# Altium schematic sheet Top_Sheet.SchDoc
size A4; SheetNumber: 1; SheetTotal: 6
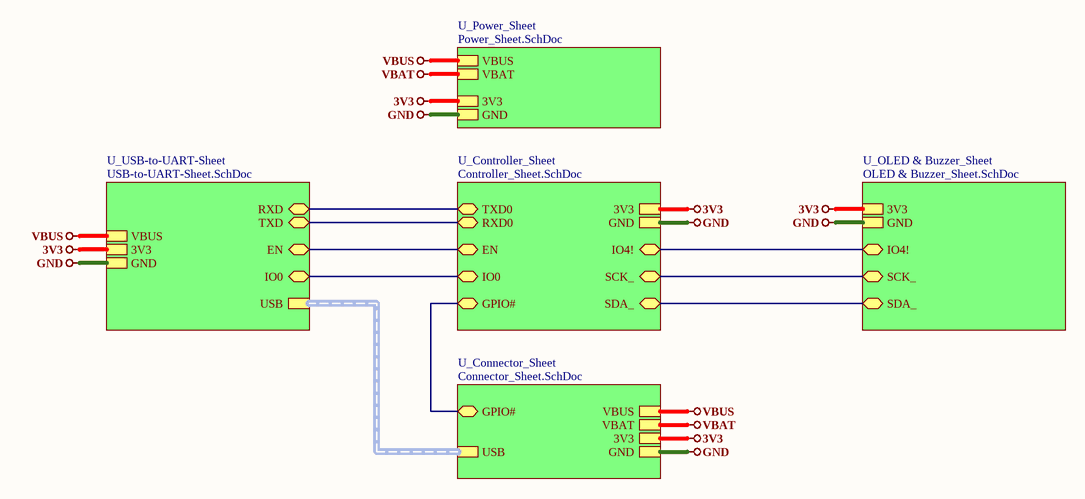
[diagram p0: Top_Sheet.SchDoc]

## Sub-sheets
U_Connector_Sheet = Connector_Sheet.SchDoc: GPIO# (bidir), USB (harness USB), GND, 3V3, VBUS, VBAT
U_Controller_Sheet = Controller_Sheet.SchDoc: SCK_ (bidir), TXD0 (bidir), RXD0 (bidir), SDA_ (bidir), EN (bidir), IO0 (bidir), GPIO# (bidir), IO4! (bidir), GND, 3V3
U_OLED & Buzzer_Sheet = OLED & Buzzer_Sheet.SchDoc: IO4! (bidir), SCK_ (bidir), SDA_ (bidir), GND, 3V3
U_Power_Sheet = Power_Sheet.SchDoc: GND, VBUS, VBAT, 3V3
U_USB-to-UART-Sheet = USB-to-UART-Sheet.SchDoc: GND, 3V3, VBUS, USB (harness USB), EN (bidir), IO0 (bidir), RXD (bidir), TXD (bidir)

## Nets
3V3: sheet U_Power_Sheet/3V3, sheet U_Controller_Sheet/3V3, sheet U_OLED & Buzzer_Sheet/3V3, sheet U_USB-to-UART-Sheet/3V3, sheet U_Connector_Sheet/3V3
GND: sheet U_Power_Sheet/GND, sheet U_Controller_Sheet/GND, sheet U_OLED & Buzzer_Sheet/GND, sheet U_USB-to-UART-Sheet/GND, sheet U_Connector_Sheet/GND
VBAT: sheet U_Power_Sheet/VBAT, sheet U_Connector_Sheet/VBAT
VBUS: sheet U_Power_Sheet/VBUS, sheet U_USB-to-UART-Sheet/VBUS, sheet U_Connector_Sheet/VBUS
(unnamed): sheet U_Controller_Sheet/SCK_, sheet U_OLED & Buzzer_Sheet/SCK_
(unnamed): sheet U_Controller_Sheet/TXD0, sheet U_USB-to-UART-Sheet/RXD
(unnamed): sheet U_Controller_Sheet/RXD0, sheet U_USB-to-UART-Sheet/TXD
(unnamed): sheet U_Controller_Sheet/SDA_, sheet U_OLED & Buzzer_Sheet/SDA_
(unnamed): sheet U_Controller_Sheet/EN, sheet U_USB-to-UART-Sheet/EN
(unnamed): sheet U_Controller_Sheet/IO0, sheet U_USB-to-UART-Sheet/IO0
(unnamed): sheet U_Controller_Sheet/GPIO#, sheet U_Connector_Sheet/GPIO#
(unnamed): sheet U_Controller_Sheet/IO4!, sheet U_OLED & Buzzer_Sheet/IO4!

## Buses and harness runs
harness sheet U_Connector_Sheet/USB = sheet U_USB-to-UART-Sheet/USB

## Notes on the sheet
- File:
- Title:
- Date:
- Page
- Num:
- Total:
- Drawn By: Huzaifa Ali